# Altium schematic sheet Top_Sheet.SchDoc
size 420 x 297 mm; SheetNumber: 1; SheetTotal: 3
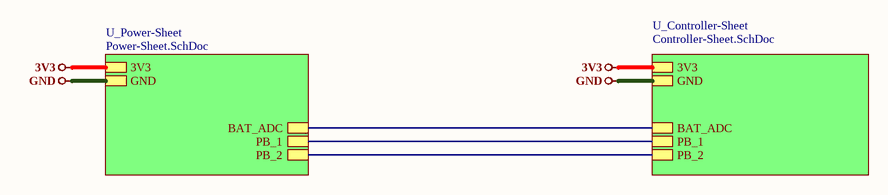
[diagram p0: Top_Sheet.SchDoc]

## Sub-sheets
U_Controller-Sheet = Controller-Sheet.SchDoc: 3V3, GND, BAT_ADC, PB_1, PB_2
U_Power-Sheet = Power-Sheet.SchDoc: 3V3, GND, BAT_ADC, PB_1, PB_2

## Nets
3V3: sheet U_Controller-Sheet/3V3, sheet U_Power-Sheet/3V3
GND: sheet U_Controller-Sheet/GND, sheet U_Power-Sheet/GND
(unnamed): sheet U_Controller-Sheet/BAT_ADC, sheet U_Power-Sheet/BAT_ADC
(unnamed): sheet U_Controller-Sheet/PB_1, sheet U_Power-Sheet/PB_1
(unnamed): sheet U_Controller-Sheet/PB_2, sheet U_Power-Sheet/PB_2

## Notes on the sheet
- File:
- Title:
- Date:
- Page
- Num:
- Total:
- Drawn By: Huzaifa Ali